# Altium schematic sheet Single_ETU_sht4.SchDoc
size 513 x 386 mm; PageSetup: Record=PageOptions|CenterHorizontal=True|CenterVertical=True|PrintScale=0.69|XCorrection=1.00|YCorrection=1.00|PrintKind=1|BorderSize=5000000|LeftOffset=0|BottomOffset=0|Orientation=2|PaperLength=1000|PaperWidth=1000|Scale=100|PaperSource=15|PrintQuality=1200|MediaType=1|DitherType=10|PrintScaleMode=1|PaperKind=Tabloid|PaperIndex=3
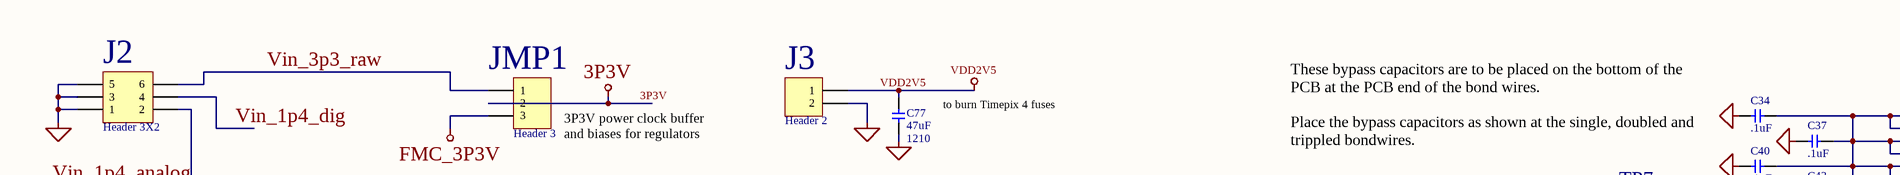
[diagram p0: Single_ETU_sht4.SchDoc, top left]
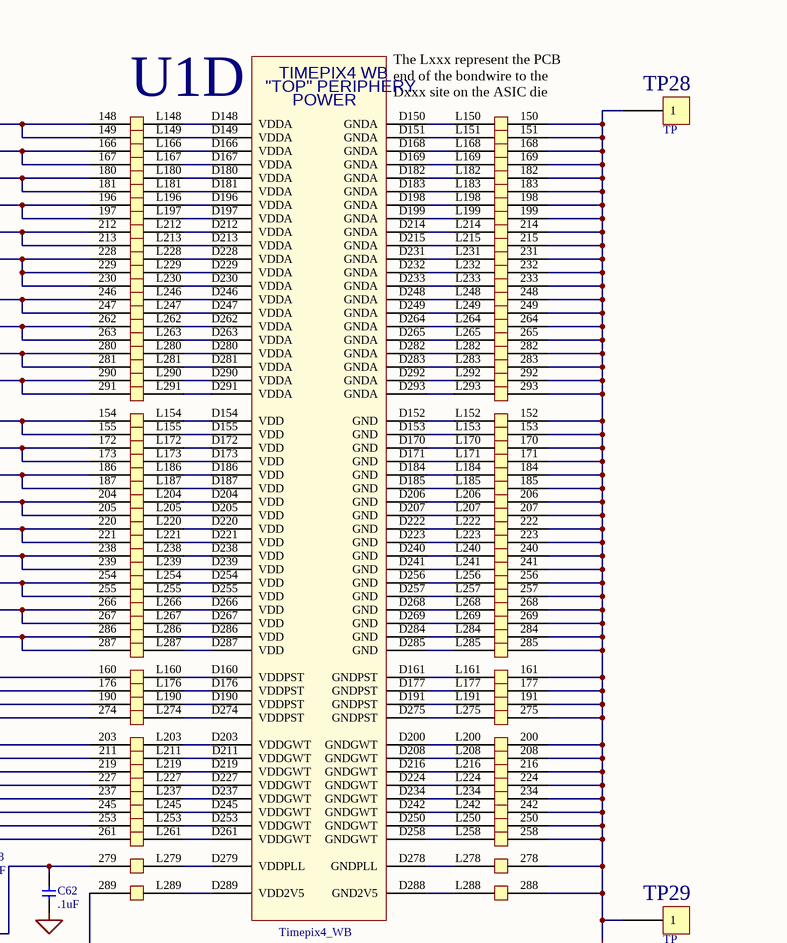
[diagram p1: Single_ETU_sht4.SchDoc, top right]
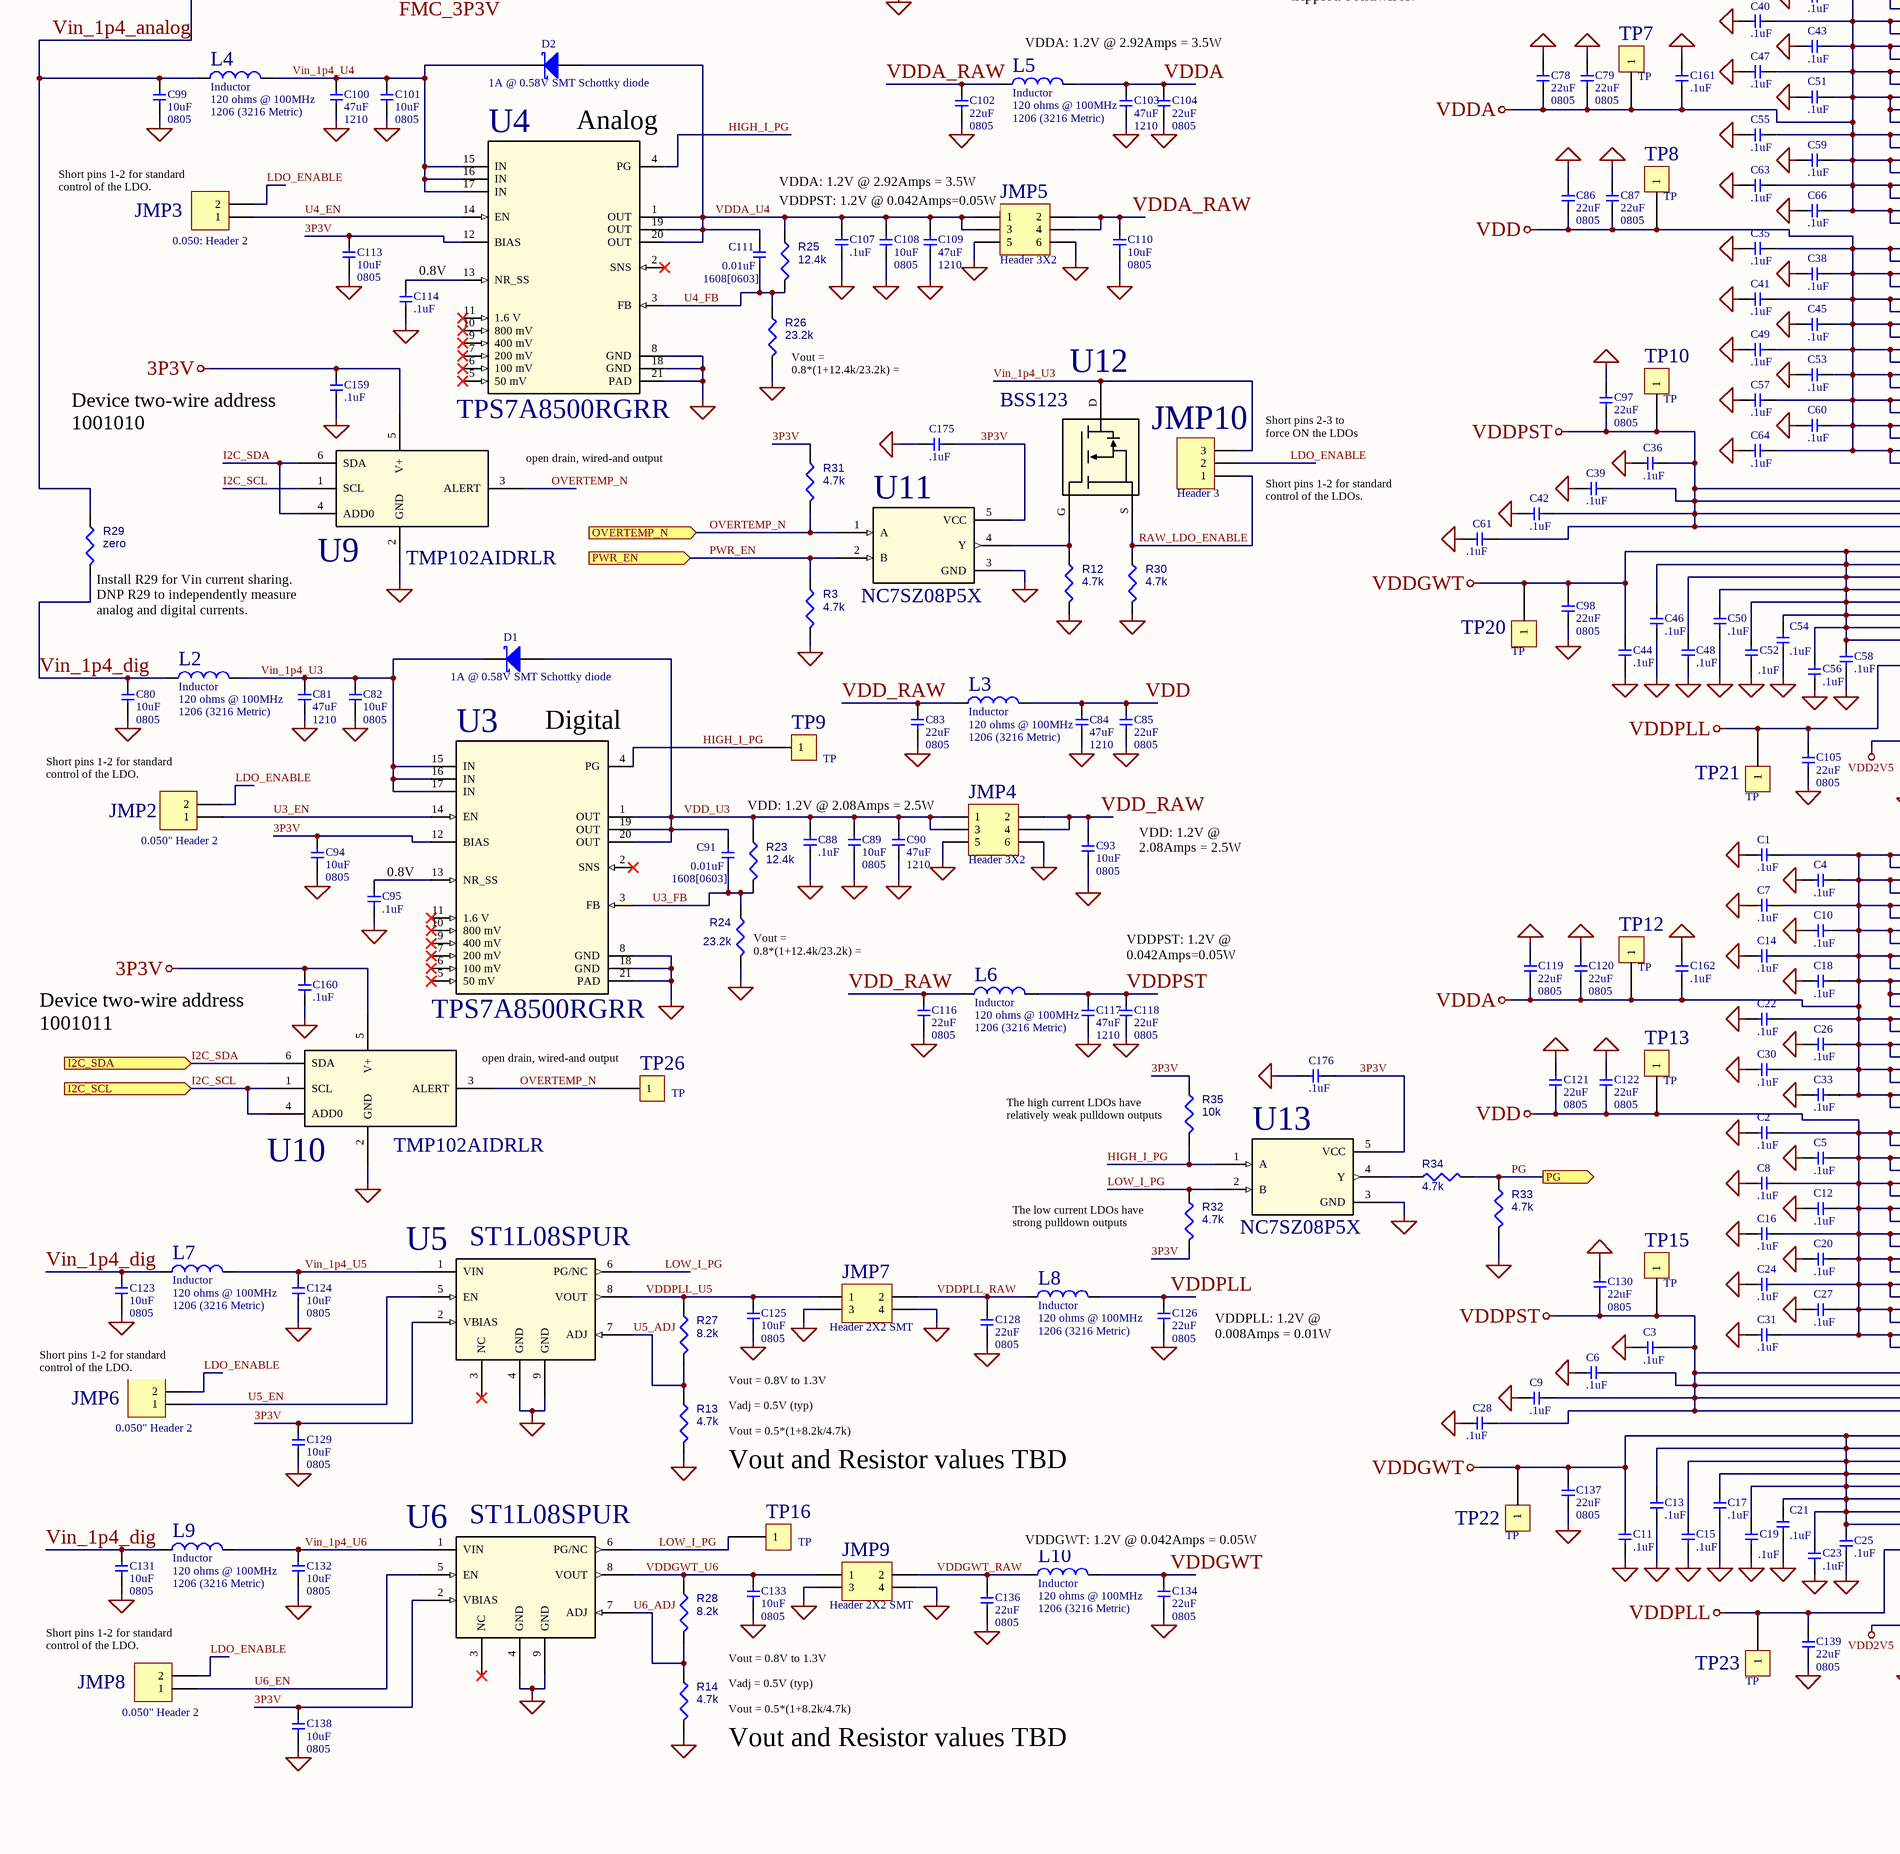
[diagram p2: Single_ETU_sht4.SchDoc, bottom left]
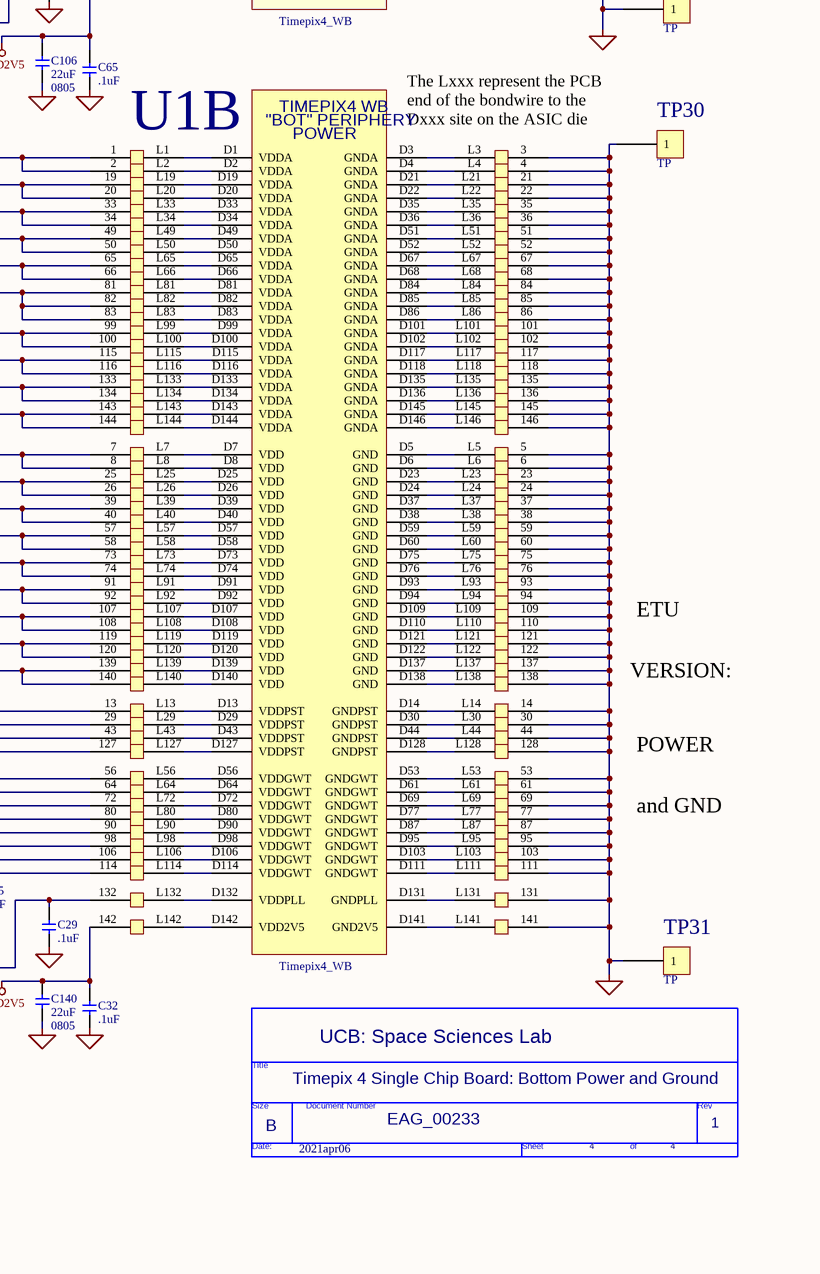
[diagram p3: Single_ETU_sht4.SchDoc, bottom right]

## Parts
*  Page Create Date: 2021apr06  RevCode: 1  Title: Timepix 4 Single Chip Board: Bottom Power and Ground  OrgName: UCB: Space Sciences Lab  Page Size: B  Page Number: 4  Document: EAG_00233  (hidden comment: TitleBlock2)  (graphical)
C1  .1uF  [CAP_0201]
C2  .1uF  [CAP_0201]
C3  .1uF  [CAP_0201]
C4  .1uF  [CAP_0201]
C5  .1uF  [CAP_0201]
C6  .1uF  [CAP_0201]
C7  .1uF  [CAP_0201]
C8  .1uF  [CAP_0201]
C9  .1uF  [CAP_0201]
C10  .1uF  [CAP_0201]
C11  .1uF  [CAP_0201]
C12  .1uF  [CAP_0201]
C13  .1uF  [CAP_0201]
C14  .1uF  [CAP_0201]
C15  .1uF  [CAP_0201]
C16  .1uF  [CAP_0201]
C17  .1uF  [CAP_0201]
C18  .1uF  [CAP_0201]
C19  .1uF  [CAP_0201]
C20  .1uF  [CAP_0201]
C21  .1uF  [CAP_0201]
C22  .1uF  [CAP_0201]
C23  .1uF  [CAP_0201]
C24  .1uF  [CAP_0201]
C25  .1uF  [CAP_0201]
C26  .1uF  [CAP_0201]
C27  .1uF  [CAP_0201]
C28  .1uF  [CAP_0201]
C29  .1uF  [CAP_0201]
C30  .1uF  [CAP_0201]
C31  .1uF  [CAP_0201]
C32  .1uF  [CAP_0201]
C33  .1uF  [CAP_0201]
C34  .1uF  [CAP_0201]
C35  .1uF  [CAP_0201]
C36  .1uF  [CAP_0201]
C37  .1uF  [CAP_0201]
C38  .1uF  [CAP_0201]
C39  .1uF  [CAP_0201]
C40  .1uF  [CAP_0201]
C41  .1uF  [CAP_0201]
C42  .1uF  [CAP_0201]
C43  .1uF  [CAP_0201]
C44  .1uF  [CAP_0201]
C45  .1uF  [CAP_0201]
C46  .1uF  [CAP_0201]
C47  .1uF  [CAP_0201]
C48  .1uF  [CAP_0201]
C49  .1uF  [CAP_0201]
C50  .1uF  [CAP_0201]
C51  .1uF  [CAP_0201]
C52  .1uF  [CAP_0201]
C53  .1uF  [CAP_0201]
C54  .1uF  [CAP_0201]
C55  .1uF  [CAP_0201]
C56  .1uF  [CAP_0201]
C57  .1uF  [CAP_0201]
C58  .1uF  [CAP_0201]
C59  .1uF  [CAP_0201]
C60  .1uF  [CAP_0201]
C61  .1uF  [CAP_0201]
C62  .1uF  [CAP_0201]
C63  .1uF  [CAP_0201]
C64  .1uF  [CAP_0201]
C65  .1uF  [CAP_0201]
C66  .1uF  [CAP_0201]
C77  47uF  Package / Case: 1210  [C1210_M]
C78  22uF  Package / Case: 0805  [C0805]
C79  22uF  Package / Case: 0805  [C0805]
C80  10uF  Package / Case: 0805  [C0805]
C81  47uF  Package / Case: 1210  [C1210_M]
C82  10uF  Package / Case: 0805  [C0805]
C83  22uF  Package / Case: 0805  [C0805]
C84  47uF  Package / Case: 1210  [C1210_M]
C85  22uF  Package / Case: 0805  [C0805]
C86  22uF  Package / Case: 0805  [C0805]
C87  22uF  Package / Case: 0805  [C0805]
C88  .1uF  [CAP_0201]
C89  10uF  Package / Case: 0805  [C0805]
C90  47uF  Package / Case: 1210  [C1210_M]
C91  0.01uF  [1608[0603]]
C93  10uF  Package / Case: 0805  [C0805]
C94  10uF  Package / Case: 0805  [C0805]
C95  .1uF  [CAP_0201]
C97  22uF  Package / Case: 0805  [C0805]
C98  22uF  Package / Case: 0805  [C0805]
C99  10uF  Package / Case: 0805  [C0805]
C100  47uF  Package / Case: 1210  [C1210_M]
C101  10uF  Package / Case: 0805  [C0805]
C102  22uF  Package / Case: 0805  [C0805]
C103  47uF  Package / Case: 1210  [C1210_M]
C104  22uF  Package / Case: 0805  [C0805]
C105  22uF  Package / Case: 0805  [C0805]
C106  22uF  Package / Case: 0805  [C0805]
C107  .1uF  [CAP_0201]
C108  10uF  Package / Case: 0805  [C0805]
C109  47uF  Package / Case: 1210  [C1210_M]
C110  10uF  Package / Case: 0805  [C0805]
C111  0.01uF  [1608[0603]]
C113  10uF  Package / Case: 0805  [C0805]
C114  .1uF  [CAP_0201]
C116  22uF  Package / Case: 0805  [C0805]
C117  47uF  Package / Case: 1210  [C1210_M]
C118  22uF  Package / Case: 0805  [C0805]
C119  22uF  Package / Case: 0805  [C0805]
C120  22uF  Package / Case: 0805  [C0805]
C121  22uF  Package / Case: 0805  [C0805]
C122  22uF  Package / Case: 0805  [C0805]
C123  10uF  Package / Case: 0805  [C0805]
C124  10uF  Package / Case: 0805  [C0805]
C125  10uF  Package / Case: 0805  [C0805]
C126  22uF  Package / Case: 0805  [C0805]
C128  22uF  Package / Case: 0805  [C0805]
C129  10uF  Package / Case: 0805  [C0805]
C130  22uF  Package / Case: 0805  [C0805]
C131  10uF  Package / Case: 0805  [C0805]
C132  10uF  Package / Case: 0805  [C0805]
C133  10uF  Package / Case: 0805  [C0805]
C134  22uF  Package / Case: 0805  [C0805]
C136  22uF  Package / Case: 0805  [C0805]
C137  22uF  Package / Case: 0805  [C0805]
C138  10uF  Package / Case: 0805  [C0805]
C139  22uF  Package / Case: 0805  [C0805]
C140  22uF  Package / Case: 0805  [C0805]
C159  .1uF  [CAP_0201]
C160  .1uF  [CAP_0201]
C161  .1uF  [CAP_0201]
C162  .1uF  [CAP_0201]
C175  .1uF  [CAP_0201]
C176  .1uF  [CAP_0201]
D1  1A @ 0.58V SMT Schottky diode  [DO-219AD]
D2  1A @ 0.58V SMT Schottky diode  [DO-219AD]
J2  Header 3X2  [HDR2X3]
J3  Header 2  [HDR1X2]
JMP1  Header 3  [HDR1X3]
JMP2  0.050" Header 2  [HDR_1x2_SMT_050]
JMP3  0.050: Header 2  [HDR_1x2_SMT_050]
JMP4  Header 3X2  [HDR_2x3]
JMP5  Header 3X2  [HDR_2x3]
JMP6  0.050" Header 2  [HDR_1x2_SMT_050]
JMP7  Header 2X2 SMT  [HDR_2x2_SMT]
JMP8  0.050" Header 2  [HDR_1x2_SMT_050]
JMP9  Header 2X2 SMT  [HDR_2x2_SMT]
JMP10  Header 3  [HDR1X3]
L2  Inductor  value 120 ohms @ 100MHz  Package / Case: 1206 (3216 Metric)  [IND_1206]
L3  Inductor  value 120 ohms @ 100MHz  Package / Case: 1206 (3216 Metric)  [IND_1206]
L4  Inductor  value 120 ohms @ 100MHz  Package / Case: 1206 (3216 Metric)  [IND_1206]
L5  Inductor  value 120 ohms @ 100MHz  Package / Case: 1206 (3216 Metric)  [IND_1206]
L6  Inductor  value 120 ohms @ 100MHz  Package / Case: 1206 (3216 Metric)  [IND_1206]
L7  Inductor  value 120 ohms @ 100MHz  Package / Case: 1206 (3216 Metric)  [IND_1206]
L8  Inductor  value 120 ohms @ 100MHz  Package / Case: 1206 (3216 Metric)  [IND_1206]
L9  Inductor  value 120 ohms @ 100MHz  Package / Case: 1206 (3216 Metric)  [IND_1206]
L10  Inductor  value 120 ohms @ 100MHz  Package / Case: 1206 (3216 Metric)  [IND_1206]
R3  4.7k  [1608[0603]]
R12  4.7k  [1608[0603]]
R13  4.7k  [1608[0603]]
R14  4.7k  [1608[0603]]
R23  12.4k  [1608[0603]]
R24  23.2k  [1608[0603]]
R25  12.4k  [1608[0603]]
R26  23.2k  [1608[0603]]
R27  8.2k  [1608[0603]]
R28  8.2k  [1608[0603]]
R29  zero  [1608[0603]]
R30  4.7k  [1608[0603]]
R31  4.7k  [1608[0603]]
R32  4.7k  [1608[0603]]
R33  4.7k  [1608[0603]]
R34  4.7k  [1608[0603]]
R35  10k  [1608[0603]]
TP7  TP  [TP]
TP8  TP  [TP]
TP9  TP  [TP]
TP10  TP  [TP]
TP12  TP  [TP]
TP13  TP  [TP]
TP15  TP  [TP]
TP16  TP  [TP]
TP20  TP  [TP]
TP21  TP  [TP]
TP22  TP  [TP]
TP23  TP  [TP]
TP26  TP  [TP]
TP28  TP  [TP]
TP29  TP  [TP]
TP30  TP  [TP]
TP31  TP  [TP]
U1  Timepix4_WB  [Timepix4_WB_bands]  (parts B,D of 4)
U3  TPS7A8500RGRR  [RGR0020A]
U4  TPS7A8500RGRR  [RGR0020A]
U5  ST1L08SPUR  [DFN8_2X3_STM]
U6  ST1L08SPUR  [DFN8_2X3_STM]
U9  TMP102AIDRLR  [DRL6]
U10  TMP102AIDRLR  [DRL6]
U11  NC7SZ08P5X  [SC70-5_ONS-L]
U12  BSS123  [SOT23-3_ONS-M]
U13  NC7SZ08P5X  [SC70-5_ONS-L]

## Ports
I2C_SCL (in), I2C_SDA (in), OVERTEMP_N (in), PG (out), PWR_EN (in)

## Nets
3P3V: C94.1 C113.1 C129.1 C138.1 C159.1 C160.1 C175.1 C176.1 JMP1.2 R31.2 R32.1 R35.2 U3.12(BIAS) U4.12(BIAS) U5.2(VBIAS) U6.2(VBIAS) U9.5(V+) U10.5(V+) U11.5(VCC) U13.5(VCC)
FMC_3P3V: JMP1.3
GND: C1.2 C2.2 C3.2 C4.2 C5.2 C6.2 C7.2 C8.2 C9.2 C10.2 C11.2 C12.2 C13.2 C14.2 C15.2 C16.2 C17.2 C18.2 C19.2 C20.2 C21.2 C22.2 C23.2 C24.2 C25.2 C26.2 C27.2 C28.2 C29.2 C30.2 C31.2 C32.2 C33.2 C34.2 C35.2 C36.2 C37.2 C38.2 C39.2 C40.2 C41.2 C42.2 C43.2 C44.2 C45.2 C46.2 C47.2 C48.2 C49.2 C50.2 C51.2 C52.2 C53.2 C54.2 C55.2 C56.2 C57.2 C58.2 C59.2 C60.2 C61.2 C62.2 C63.2 C64.2 C65.2 C66.2 C77.2 C78.2 C79.2 C80.2 C81.2 C82.2 C83.2 C84.2 C85.2 C86.2 C87.2 C88.2 C89.2 C90.2 C93.2 C94.2 C95.2 C97.2 C98.2 C99.2 C100.2 C101.2 C102.2 C103.2 C104.2 C105.2 C106.2 C107.2 C108.2 C109.2 C110.2 C113.2 C114.2 C116.2 C117.2 C118.2 C119.2 C120.2 C121.2 C122.2 C123.2 C124.2 C125.2 C126.2 C128.2 C129.2 C130.2 C131.2 C132.2 C133.2 C134.2 C136.2 C137.2 C138.2 C139.2 C140.2 C159.2 C160.2 C161.2 C162.2 C175.2 C176.2 J2.1 J2.3 J2.5 J3.2 JMP4.5 JMP4.6 JMP5.5 JMP5.6 JMP7.3 JMP7.4 JMP9.3 JMP9.4 R3.1 R12.1 R13.1 R14.1 R24.1 R26.1 R30.1 R33.1 TP28.1 TP29.1 TP30.1 TP31.1 U1.3 U1.4 U1.5 U1.6 U1.14 U1.21 U1.22 U1.23 U1.24 U1.30 U1.35 U1.36 U1.37 U1.38 U1.44 U1.51 U1.52 U1.53 U1.59 U1.60 U1.61 U1.67 U1.68 U1.69 U1.75 U1.76 U1.77 U1.84 U1.85 U1.86 U1.87 U1.93 U1.94 U1.95 U1.101 U1.102 U1.103 U1.109 U1.110 U1.111 U1.117 U1.118 U1.121 U1.122 U1.128 U1.131 U1.135 U1.136 U1.137 U1.138 U1.141 U1.145 U1.146 U1.150 U1.151 U1.152 U1.153 U1.161 U1.168 U1.169 U1.170 U1.171 U1.177 U1.182 U1.183 U1.184 U1.185 U1.191 U1.198 U1.199 U1.200 U1.206 U1.207 U1.208 U1.214 U1.215 U1.216 U1.222 U1.223 U1.224 U1.231 U1.232 U1.233 U1.234 U1.240 U1.241 U1.242 U1.248 U1.249 U1.250 U1.256 U1.257 U1.258 U1.264 U1.265 U1.268 U1.269 U1.275 U1.278 U1.282 U1.283 U1.284 U1.285 U1.288 U1.292 U1.293 U3.8(GND) U3.18(GND) U3.21(PAD) U4.8(GND) U4.18(GND) U4.21(PAD) U5.4(GND) U5.9(GND) U6.4(GND) U6.9(GND) U9.2(GND) U10.2(GND) U11.3(GND) U13.3(GND)
VDD: C2.1 C5.1 C8.1 C12.1 C16.1 C20.1 C24.1 C27.1 C31.1 C35.1 C38.1 C41.1 C45.1 C49.1 C53.1 C57.1 C60.1 C64.1 C84.1 C85.1 C86.1 C87.1 C121.1 C122.1 L3.2 TP8.1 TP13.1 U1.7 U1.8 U1.25 U1.26 U1.39 U1.40 U1.57 U1.58 U1.73 U1.74 U1.91 U1.92 U1.107 U1.108 U1.119 U1.120 U1.139 U1.140 U1.154 U1.155 U1.172 U1.173 U1.186 U1.187 U1.204 U1.205 U1.220 U1.221 U1.238 U1.239 U1.254 U1.255 U1.266 U1.267 U1.286 U1.287
VDD2V5: C32.1 C65.1 C77.1 C106.1 C140.1 J3.1 U1.142 U1.289
VDDA: C1.1 C4.1 C7.1 C10.1 C14.1 C18.1 C22.1 C26.1 C30.1 C33.1 C34.1 C37.1 C40.1 C43.1 C47.1 C51.1 C55.1 C59.1 C63.1 C66.1 C78.1 C79.1 C103.1 C104.1 C119.1 C120.1 C161.1 C162.1 L5.2 TP7.1 TP12.1 U1.1 U1.2 U1.19 U1.20 U1.33 U1.34 U1.49 U1.50 U1.65 U1.66 U1.81 U1.82 U1.83 U1.99 U1.100 U1.115 U1.116 U1.133 U1.134 U1.143 U1.144 U1.148 U1.149 U1.166 U1.167 U1.180 U1.181 U1.196 U1.197 U1.212 U1.213 U1.228 U1.229 U1.230 U1.246 U1.247 U1.262 U1.263 U1.280 U1.281 U1.290 U1.291
VDDGWT: C11.1 C13.1 C15.1 C17.1 C19.1 C21.1 C23.1 C25.1 C44.1 C46.1 C48.1 C50.1 C52.1 C54.1 C56.1 C58.1 C98.1 C134.1 C137.1 L10.2 TP20.1 TP22.1 U1.56 U1.64 U1.72 U1.80 U1.90 U1.98 U1.106 U1.114 U1.203 U1.211 U1.219 U1.227 U1.237 U1.245 U1.253 U1.261
VDDPLL: C29.1 C62.1 C105.1 C126.1 C139.1 L8.2 TP21.1 TP23.1 U1.132 U1.279
VDDPST: C3.1 C6.1 C9.1 C28.1 C36.1 C39.1 C42.1 C61.1 C97.1 C117.1 C118.1 C130.1 L6.2 TP10.1 TP15.1 U1.13 U1.29 U1.43 U1.127 U1.160 U1.176 U1.190 U1.274
HIGH_I_PG: R35.1 TP9.1 U3.4(PG) U4.4(PG) U13.1(A)
I2C_SCL: U9.1(SCL) U10.1(SCL) U10.4(ADD0) ; port I2C_SCL
I2C_SDA: U9.4(ADD0) U9.6(SDA) U10.6(SDA) ; port I2C_SDA
LDO_ENABLE: JMP2.2 JMP3.2 JMP6.2 JMP8.2 JMP10.2
LOW_I_PG: R32.2 TP16.1 U5.6(PG/NC) U6.6(PG/NC) U13.2(B)
OVERTEMP_N: R31.1 TP26.1 U9.3(ALERT) U10.3(ALERT) U11.1(A) ; port OVERTEMP_N
PG: R33.2 R34.1 ; port PG
PWR_EN: R3.2 U11.2(B) ; port PWR_EN
RAW_LDO_ENABLE: JMP10.1 R30.2 U12.S(SOURCE)
U3_EN: JMP2.1 U3.14(EN)
U3_FB: C91.2 R23.1 R24.2 U3.3(FB)
U4_EN: JMP3.1 U4.14(EN)
U4_FB: C111.2 R25.1 R26.2 U4.3(FB)
U5_ADJ: R13.2 R27.1 U5.7(ADJ)
U5_EN: JMP6.1 U5.5(EN)
U6_ADJ: R14.2 R28.1 U6.7(ADJ)
U6_EN: JMP8.1 U6.5(EN)
VDD_RAW: C83.1 C93.1 C116.1 JMP4.2 JMP4.4 L3.1 L6.1
VDD_U3: C88.1 C89.1 C90.1 C91.1 D1.1(A) JMP4.1 JMP4.3 R23.2 U3.1(OUT) U3.19(OUT) U3.20(OUT)
VDDA_RAW: C102.1 C110.1 JMP5.2 JMP5.4 L5.1
VDDA_U4: C107.1 C108.1 C109.1 C111.1 D2.1(A) JMP5.1 JMP5.3 R25.2 U4.1(OUT) U4.19(OUT) U4.20(OUT)
VDDGWT_RAW: C136.1 JMP9.2 L10.1
VDDGWT_U6: C133.1 JMP9.1 R28.2 U6.8(VOUT)
VDDPLL_RAW: C128.1 JMP7.2 L8.1
VDDPLL_U5: C125.1 JMP7.1 R27.2 U5.8(VOUT)
Vin_1p4_analog: C99.1 J2.2 L4.1 R29.2
Vin_1p4_dig: C80.1 C123.1 C131.1 J2.4 L2.1 L7.1 L9.1 R29.1
Vin_1p4_U3: C81.1 C82.1 D1.2(K) JMP10.3 L2.2 U3.15(IN) U3.16(IN) U3.17(IN) U12.D(DRAIN)
Vin_1p4_U4: C100.1 C101.1 D2.2(K) L4.2 U4.15(IN) U4.16(IN) U4.17(IN)
Vin_1p4_U5: C124.1 L7.2 U5.1(VIN)
Vin_1p4_U6: C132.1 L9.2 U6.1(VIN)
Vin_3p3_raw: J2.6 JMP1.1
NetC95_1: C95.1 U3.13(NR_SS)
NetC114_1: C114.1 U4.13(NR_SS)
NetR12_2: R12.2 U11.4(Y) U12.G(GATE)
NetR34_2: R34.2 U13.4(Y)
NetU1_D1: U1.D1(VDDA) U1.L1
NetU1_D2: U1.D2(VDDA) U1.L2
NetU1_D3: U1.D3(GNDA) U1.L3
NetU1_D4: U1.D4(GNDA) U1.L4
NetU1_D5: U1.D5(GND) U1.L5
NetU1_D6: U1.D6(GND) U1.L6
NetU1_D7: U1.D7(VDD) U1.L7
NetU1_D8: U1.D8(VDD) U1.L8
NetU1_D13: U1.D13(VDDPST) U1.L13
NetU1_D14: U1.D14(GNDPST) U1.L14
NetU1_D19: U1.D19(VDDA) U1.L19
NetU1_D20: U1.D20(VDDA) U1.L20
NetU1_D21: U1.D21(GNDA) U1.L21
NetU1_D22: U1.D22(GNDA) U1.L22
NetU1_D23: U1.D23(GND) U1.L23
NetU1_D24: U1.D24(GND) U1.L24
NetU1_D25: U1.D25(VDD) U1.L25
NetU1_D26: U1.D26(VDD) U1.L26
NetU1_D29: U1.D29(VDDPST) U1.L29
NetU1_D30: U1.D30(GNDPST) U1.L30
NetU1_D33: U1.D33(VDDA) U1.L33
NetU1_D34: U1.D34(VDDA) U1.L34
NetU1_D35: U1.D35(GNDA) U1.L35
NetU1_D36: U1.D36(GNDA) U1.L36
NetU1_D37: U1.D37(GND) U1.L37
NetU1_D38: U1.D38(GND) U1.L38
NetU1_D39: U1.D39(VDD) U1.L39
NetU1_D40: U1.D40(VDD) U1.L40
NetU1_D43: U1.D43(VDDPST) U1.L43
NetU1_D44: U1.D44(GNDPST) U1.L44
NetU1_D49: U1.D49(VDDA) U1.L49
NetU1_D50: U1.D50(VDDA) U1.L50
NetU1_D51: U1.D51(GNDA) U1.L51
NetU1_D52: U1.D52(GNDA) U1.L52
NetU1_D53: U1.D53(GNDGWT) U1.L53
NetU1_D56: U1.D56(VDDGWT) U1.L56
NetU1_D57: U1.D57(VDD) U1.L57
NetU1_D58: U1.D58(VDD) U1.L58
NetU1_D59: U1.D59(GND) U1.L59
NetU1_D60: U1.D60(GND) U1.L60
NetU1_D61: U1.D61(GNDGWT) U1.L61
NetU1_D64: U1.D64(VDDGWT) U1.L64
NetU1_D65: U1.D65(VDDA) U1.L65
NetU1_D66: U1.D66(VDDA) U1.L66
NetU1_D67: U1.D67(GNDA) U1.L67
NetU1_D68: U1.D68(GNDA) U1.L68
NetU1_D69: U1.D69(GNDGWT) U1.L69
NetU1_D72: U1.D72(VDDGWT) U1.L72
NetU1_D73: U1.D73(VDD) U1.L73
NetU1_D74: U1.D74(VDD) U1.L74
NetU1_D75: U1.D75(GND) U1.L75
NetU1_D76: U1.D76(GND) U1.L76
NetU1_D77: U1.D77(GNDGWT) U1.L77
NetU1_D80: U1.D80(VDDGWT) U1.L80
NetU1_D81: U1.D81(VDDA) U1.L81
NetU1_D82: U1.D82(VDDA) U1.L82
NetU1_D83: U1.D83(VDDA) U1.L83
NetU1_D84: U1.D84(GNDA) U1.L84
NetU1_D85: U1.D85(GNDA) U1.L85
NetU1_D86: U1.D86(GNDA) U1.L86
NetU1_D87: U1.D87(GNDGWT) U1.L87
NetU1_D90: U1.D90(VDDGWT) U1.L90
NetU1_D91: U1.D91(VDD) U1.L91
NetU1_D92: U1.D92(VDD) U1.L92
NetU1_D93: U1.D93(GND) U1.L93
NetU1_D94: U1.D94(GND) U1.L94
NetU1_D95: U1.D95(GNDGWT) U1.L95
NetU1_D98: U1.D98(VDDGWT) U1.L98
NetU1_D99: U1.D99(VDDA) U1.L99
NetU1_D100: U1.D100(VDDA) U1.L100
NetU1_D101: U1.D101(GNDA) U1.L101
NetU1_D102: U1.D102(GNDA) U1.L102
NetU1_D103: U1.D103(GNDGWT) U1.L103
NetU1_D106: U1.D106(VDDGWT) U1.L106
NetU1_D107: U1.D107(VDD) U1.L107
NetU1_D108: U1.D108(VDD) U1.L108
NetU1_D109: U1.D109(GND) U1.L109
NetU1_D110: U1.D110(GND) U1.L110
NetU1_D111: U1.D111(GNDGWT) U1.L111
NetU1_D114: U1.D114(VDDGWT) U1.L114
NetU1_D115: U1.D115(VDDA) U1.L115
NetU1_D116: U1.D116(VDDA) U1.L116(L8)
NetU1_D117: U1.D117(GNDA) U1.L117
NetU1_D118: U1.D118(GNDA) U1.L118
NetU1_D119: U1.D119(VDD) U1.L119
NetU1_D120: U1.D120(VDD) U1.L120
NetU1_D121: U1.D121(GND) U1.L121
NetU1_D122: U1.D122(GND) U1.L122
NetU1_D127: U1.D127(VDDPST) U1.L127
NetU1_D128: U1.D128(GNDPST) U1.L128
NetU1_D131: U1.D131(GNDPLL) U1.L131
NetU1_D132: U1.D132(VDDPLL) U1.L132
NetU1_D133: U1.D133(VDDA) U1.L133
NetU1_D134: U1.D134(VDDA) U1.L134
NetU1_D135: U1.D135(GNDA) U1.L135
NetU1_D136: U1.D136(GNDA) U1.L136
NetU1_D137: U1.D137(GND) U1.L137
NetU1_D138: U1.D138(GND) U1.L138
NetU1_D139: U1.D139(VDD) U1.L139
NetU1_D140: U1.D140(VDD) U1.L140
NetU1_D141: U1.D141(GND2V5) U1.L141
NetU1_D142: U1.D142(VDD2V5) U1.L142
NetU1_D143: U1.D143(VDDA) U1.L143
NetU1_D144: U1.D144(VDDA) U1.L144
NetU1_D145: U1.D145(GNDA) U1.L145
NetU1_D146: U1.D146(GNDA) U1.L146
NetU1_D148: U1.D148(VDDA) U1.L148
NetU1_D149: U1.D149(VDDA) U1.L149
NetU1_D150: U1.D150(GNDA) U1.L150
NetU1_D151: U1.D151(GNDA) U1.L151
NetU1_D152: U1.D152(GND) U1.L152
NetU1_D153: U1.D153(GND) U1.L153
NetU1_D154: U1.D154(VDD) U1.L154
NetU1_D155: U1.D155(VDD) U1.L155
NetU1_D160: U1.D160(VDDPST) U1.L160
NetU1_D161: U1.D161(GNDPST) U1.L161
NetU1_D166: U1.D166(VDDA) U1.L166
NetU1_D167: U1.D167(VDDA) U1.L167
NetU1_D168: U1.D168(GNDA) U1.L168
NetU1_D169: U1.D169(GNDA) U1.L169
NetU1_D170: U1.D170(GND) U1.L170
NetU1_D171: U1.D171(GND) U1.L171
NetU1_D172: U1.D172(VDD) U1.L172
NetU1_D173: U1.D173(VDD) U1.L173
NetU1_D176: U1.D176(VDDPST) U1.L176
NetU1_D177: U1.D177(GNDPST) U1.L177
NetU1_D180: U1.D180(VDDA) U1.L180
NetU1_D181: U1.D181(VDDA) U1.L181
NetU1_D182: U1.D182(GNDA) U1.L182
NetU1_D183: U1.D183(GNDA) U1.L183
NetU1_D184: U1.D184(GND) U1.L184
NetU1_D185: U1.D185(GND) U1.L185
NetU1_D186: U1.D186(VDD) U1.L186
NetU1_D187: U1.D187(VDD) U1.L187
NetU1_D190: U1.D190(VDDPST) U1.L190
NetU1_D191: U1.D191(GNDPST) U1.L191
NetU1_D196: U1.D196(VDDA) U1.L196
NetU1_D197: U1.D197(VDDA) U1.L197
NetU1_D198: U1.D198(GNDA) U1.L198
NetU1_D199: U1.D199(GNDA) U1.L199
NetU1_D200: U1.D200(GNDGWT) U1.L200
NetU1_D203: U1.D203(VDDGWT) U1.L203
NetU1_D204: U1.D204(VDD) U1.L204
NetU1_D205: U1.D205(VDD) U1.L205
NetU1_D206: U1.D206(GND) U1.L206
NetU1_D207: U1.D207(GND) U1.L207
NetU1_D208: U1.D208(GNDGWT) U1.L208
NetU1_D211: U1.D211(VDDGWT) U1.L211
NetU1_D212: U1.D212(VDDA) U1.L212
NetU1_D213: U1.D213(VDDA) U1.L213
NetU1_D214: U1.D214(GNDA) U1.L214
NetU1_D215: U1.D215(GNDA) U1.L215
NetU1_D216: U1.D216(GNDGWT) U1.L216
NetU1_D219: U1.D219(VDDGWT) U1.L219
NetU1_D220: U1.D220(VDD) U1.L220
NetU1_D221: U1.D221(VDD) U1.L221
NetU1_D222: U1.D222(GND) U1.L222
NetU1_D223: U1.D223(GND) U1.L223
NetU1_D224: U1.D224(GNDGWT) U1.L224
NetU1_D227: U1.D227(VDDGWT) U1.L227
NetU1_D228: U1.D228(VDDA) U1.L228
NetU1_D229: U1.D229(VDDA) U1.L229
NetU1_D230: U1.D230(VDDA) U1.L230
NetU1_D231: U1.D231(GNDA) U1.L231
NetU1_D232: U1.D232(GNDA) U1.L232
NetU1_D233: U1.D233(GNDA) U1.L233
NetU1_D234: U1.D234(GNDGWT) U1.L234
NetU1_D237: U1.D237(VDDGWT) U1.L237
NetU1_D238: U1.D238(VDD) U1.L238
NetU1_D239: U1.D239(VDD) U1.L239
NetU1_D240: U1.D240(GND) U1.L240
NetU1_D241: U1.D241(GND) U1.L241
NetU1_D242: U1.D242(GNDGWT) U1.L242
NetU1_D245: U1.D245(VDDGWT) U1.L245
NetU1_D246: U1.D246(VDDA) U1.L246
NetU1_D247: U1.D247(VDDA) U1.L247
NetU1_D248: U1.D248(GNDA) U1.L248
NetU1_D249: U1.D249(GNDA) U1.L249
NetU1_D250: U1.D250(GNDGWT) U1.L250
NetU1_D253: U1.D253(VDDGWT) U1.L253
NetU1_D254: U1.D254(VDD) U1.L254
NetU1_D255: U1.D255(VDD) U1.L255
NetU1_D256: U1.D256(GND) U1.L256
NetU1_D257: U1.D257(GND) U1.L257
NetU1_D258: U1.D258(GNDGWT) U1.L258
NetU1_D261: U1.D261(VDDGWT) U1.L261
NetU1_D262: U1.D262(VDDA) U1.L262
NetU1_D263: U1.D263(VDDA) U1.L263(L155)
NetU1_D264: U1.D264(GNDA) U1.L264
NetU1_D265: U1.D265(GNDA) U1.L265
NetU1_D266: U1.D266(VDD) U1.L266
NetU1_D267: U1.D267(VDD) U1.L267
NetU1_D268: U1.D268(GND) U1.L268
NetU1_D269: U1.D269(GND) U1.L269
NetU1_D274: U1.D274(VDDPST) U1.L274
NetU1_D275: U1.D275(GNDPST) U1.L275
NetU1_D278: U1.D278(GNDPLL) U1.L278
NetU1_D279: U1.D279(VDDPLL) U1.L279
NetU1_D280: U1.D280(VDDA) U1.L280
NetU1_D281: U1.D281(VDDA) U1.L281
NetU1_D282: U1.D282(GNDA) U1.L282
NetU1_D283: U1.D283(GNDA) U1.L283
NetU1_D284: U1.D284(GND) U1.L284
NetU1_D285: U1.D285(GND) U1.L285
NetU1_D286: U1.D286(VDD) U1.L286
NetU1_D287: U1.D287(VDD) U1.L287
NetU1_D288: U1.D288(GND2V5) U1.L288
NetU1_D289: U1.D289(VDD2V5) U1.L289
NetU1_D290: U1.D290(VDDA) U1.L290
NetU1_D291: U1.D291(VDDA) U1.L291
NetU1_D292: U1.D292(GNDA) U1.L292
NetU1_D293: U1.D293(GNDA) U1.L293

Not connected (* = marked no-connect by the designer): U3 2(SNS)* 5(50_mV)* 6(100_mV)* 7(200_mV)* 9(400_mV)* 10(800_mV)* 11(1.6_V)*; U4 2(SNS)* 5(50_mV)* 6(100_mV)* 7(200_mV)* 9(400_mV)* 10(800_mV)* 11(1.6_V)*; U5 3(NC)*; U6 3(NC)*

## Notes on the sheet
- (near C77) to burn Timepix 4 fuses
- (near U1) The Lxxx represent the PCB
  end of the bondwire to the
  Dxxx site on the ASIC die
- 3P3V power clock buffer
  and biases for regulators
- VDDA: 1.2V @ 2.92Amps = 3.5W
- These bypass capacitors are to be placed on the bottom of the PCB at the PCB end of the bond wires.
  Place the bypass capacitors as shown at the single, doubled and trippled bondwires.
- Analog
- (near JMP3) Short pins 1-2 for standard
  control of the LDO.
- (near JMP5) VDDPST: 1.2V @ 0.042Amps=0.05W
- 0.8V
- Device two-wire address
  1001010
- (near R26) Vout = 0.8*(1+12.4k/23.2k) = 1.2276V
- Short pins 2-3 to
  force ON the LDOs
- (near U9) open drain, wired-and output
- Short pins 1-2 for standard
  control of the LDOs.
- (near R29) Install R29 for Vin current sharing.
  DNP R29 to independently measure analog and digital currents.
- Digital
- (near JMP2) Short pins 1-2 for standard
  control of the LDO.
- VDD: 1.2V @ 2.08Amps = 2.5W
- VDD: 1.2V @
  2.08Amps = 2.5W
- The Lxxx represent the PCB
  end of the bondwire to the
  Dxxx site on the ASIC die
- (near R24) Vout = 0.8*(1+12.4k/23.2k) = 1.2276V
- VDDPST: 1.2V @
  0.042Amps=0.05W
- Device two-wire address
  1001011
- open drain, wired-and output
- (near R35) The high current LDOs have relatively weak pulldown outputs
- (near R32) The low current LDOs have strong pulldown outputs
- ETU
- (near JMP6) Short pins 1-2 for standard
  control of the LDO.
- VDDPLL: 1.2V @
  0.008Amps = 0.01W
- VERSION:
- Vadj = 0.5V (typ)
- Vout = 0.8V to 1.3V
- (near R13) Vout = 0.5*(1+8.2k/4.7k)
- POWER
- Vout and Resistor values TBD
- and GND
- VDDGWT: 1.2V @ 0.042Amps = 0.05W
- (near JMP8) Short pins 1-2 for standard
  control of the LDO.
- (near R14) Vout = 0.5*(1+8.2k/4.7k)
- (near R14) Vout and Resistor values TBD
- (in symbol Timepix4_WB, part B) TIMEPIX4 WB; "BOT" PERIPHERY; POWER
- (in symbol Timepix4_WB, part D) TIMEPIX4 WB; "TOP" PERIPHERY; POWER
- (in symbol TitleBlock2) Title; Size; Document Number; Rev; Date:; Sheet; of

## Library data of the parts
* = TitleBlock2: OrgAddr3: MRD; Page Count: 4
C1-C66 C159-C162 = cap 0.1uF: CAP CER 0.1UF 10V 10% X5R 0201; Voltage - Rated: 6.3V; Supplier 1: Digi-Key; RoHS: RoHS Compliant; Category: Capacitors; Packaging: Cut Tape (CT); Capacitance: .1uF; Tolerance: ±10%; Temperature Coefficient: X5R; Mounting Type: Surface Mount, MLCC; Operating Temperature: -55°C ~ 85°C; Applications: General Purpose; Ratings: -; Package / Case: 0201 (0603 Metric); Size / Dimension: 0.024" L x 0.012" W (0.60mm x 0.30mm); Height - Seated (Max): .013" (0.33mm); Thickness (Max): 0.013" (0.33mm); Lead Spacing: -; Features: -; Lead Style: -
C77 C81 C84 C90 C100 C103 C109 C117 = cap 0.1uF: CAP CER 47UF 10V 10% X7R 1210; Manufacturer: Murata; Supplier 1: Digi-Key; RoHS: RoHS Compliant; Category: Capacitors; Packaging: Cut Tape (CT); Capacitance: 47uF; Voltage - Rated: 10V; Tolerance: ±10%; Temperature Coefficient: X7R; Mounting Type: Surface Mount, MLCC; Operating Temperature: -55°C ~ 125°C; Applications: General Purpose; Ratings: -; Size / Dimension: 0.126" L x 0.098" W (3.20mm x 2.50mm); Height - Seated (Max): .106" (2,7mm); Thickness (Max): 0.106" (2.7mm); Lead Spacing: -; Features: -; Lead Style: -; ComponentLink1URL: Murata; ComponentLink1Description: Murata; ComponentLink2URL: Murata; ComponentLink3URL: Murata
C78 C79 C83 C85-C87 C97 C98 C102 C104-C106 C116 C118-C122 C126 C128 C130 C134 C136 C137 C139 C140 = cap 0.1uF: CAP CER 22UF 10V 10% X5R 0805; Supplier 1: Digi-Key; RoHS: RoHS Compliant; Category: Capacitors; Packaging: Cut Tape (CT); Capacitance: 22uF; Voltage - Rated: 10V; Tolerance: ±10%; Temperature Coefficient: X5R; Mounting Type: Surface Mount, MLCC; Operating Temperature: -55°C ~ 85°C; Applications: General Purpose; Ratings: -; Size / Dimension: 0.079" L x 0.024" W (2.00mm x 1.25mm); Height - Seated (Max): .055" (1.40mm); Thickness (Max): 0.055" (1.4mm); Lead Spacing: -; Features: -; Lead Style: -; ComponentLink1URL: Samsung...; ComponentLink1Description: Samsung...; ComponentLink2URL: Samsung...; ComponentLink3URL: Samsung...
C80 C82 C89 C93 C94 C99 C101 C108 C110 C113 C123-C125 C129 C131-C133 C138 = cap 0.1uF: CAP CER 10UF 10V 10% X7R 0805; Supplier 1: Digi-Key; RoHS: RoHS Compliant; Category: Capacitors; Packaging: Cut Tape (CT); Capacitance: 10uF; Voltage - Rated: 10V; Tolerance: ±10%; Temperature Coefficient: X7R; Mounting Type: Surface Mount, MLCC; Operating Temperature: -55°C ~ 125°C; Applications: General Purpose; Ratings: -; Size / Dimension: 0.079" L x 0.024" W (2.00mm x 1.25mm); Height - Seated (Max): .055" (1.40mm); Thickness (Max): 0.055" (1.4mm); Lead Spacing: -; Features: -; Lead Style: -; ComponentLink1URL: Samsung...; ComponentLink1Description: Samsung...; ComponentLink2URL: Samsung...; ComponentLink3URL: Samsung...
C88 C95 C107 C114 C175 C176 = cap 0.1uF: CAP CER 0.1UF 10V 10% X5R 0201; Manufacturer: TDK Corporation; Voltage - Rated: 6.3V; Supplier 1: Digi-Key; RoHS: RoHS Compliant; Category: Capacitors; Packaging: Cut Tape (CT); Capacitance: .1uF; Tolerance: ±10%; Temperature Coefficient: X5R; Mounting Type: Surface Mount, MLCC; Operating Temperature: -55°C ~ 85°C; Applications: General Purpose; Ratings: -; Package / Case: 0201 (0603 Metric); Size / Dimension: 0.024" L x 0.012" W (0.60mm x 0.30mm); Height - Seated (Max): .013" (0.33mm); Thickness (Max): 0.013" (0.33mm); Lead Spacing: -; Features: -; Lead Style: -; ComponentLink1URL: http://www.tdk.com/pdf/mlcc_prod_guide/MLCC%20Product%20Guide%20A14.pdf; ComponentLink1Description: http://www.tdk.com/pdf/TDKMLCCCapRange.pdf; ComponentLink2URL: http://product.tdk.com/en/catalog/datasheets/mlcc_commercial_general_en.pdf; ComponentLink3URL: http://product.tdk.com/en/catalog/spec/mlccspec_commercial_general_midvoltage_en.pdf
C91 C111 = cap 0.1uF: CAP CER 0.01UF 10V 10% X5R 0603; Supplier 1: Digi-Key; RoHS: RoHS Compliant; Category: Capacitors; Packaging: Cut Tape (CT); Capacitance: 0.01uF; Voltage - Rated: 10V; Tolerance: ±10%; Temperature Coefficient: X5R; Mounting Type: Surface Mount, MLCC; Operating Temperature: -55°C ~ 85°C; Applications: General Purpose; Ratings: -; Package / Case: 1608[0603]; Size / Dimension: 0.063" L x 0.031" W (1.60mm x 0.80mm); Height - Seated (Max): .037" (0.95mm); Thickness (Max): 0.037" (0.95mm); Lead Spacing: -; Features: -; Lead Style: -; ComponentLink1Description: http://www.tdk.com/pdf/TDKMLCCCapRange.pdf; ComponentLink2URL: http://product.tdk.com/en/catalog/datasheets/mlcc_commercial_general_en.pdf; ComponentLink3URL: http://product.tdk.com/en/catalog/spec/mlccspec_commercial_general_midvoltage_en.pdf
D1 D2 = D Schottky: 1A @ 0.58V SMT Schottky diode, TJ -40 to +175degC, Vrrm 100V, Ir 200uA @ 70V @125degC, DO-219AD (MicroSMP); ETU_manf: Vishay; ETU_PN: V1PM10-M3/H; ETU_PN_PO: V1PM10-M3/HGICT-ND; ETU_vendor: Digikey.com; package: DO-219ADC
J2 = Header 3X2: Header, 3-Pin, Dual row; LatestRevisionDate: 17-Jul-2002; LatestRevisionNote: Re-released for DXP Platform.; Publisher: Altium Limited
J3 = Header 2: Header, 2-Pin; LatestRevisionDate: 17-Jul-2002; LatestRevisionNote: Re-released for DXP Platform.; Publisher: Altium Limited
JMP1 JMP10 = Header 3: Header, 3-Pin; LatestRevisionDate: 17-Jul-2002; LatestRevisionNote: Re-released for DXP Platform.; Publisher: Altium Limited
JMP2 JMP3 JMP6 JMP8 = Header 2: Header, 2-Pin, 0.05" pitch; LatestRevisionDate: 17-Jul-2002; LatestRevisionNote: Re-released for DXP Platform.; Publisher: Altium Limited
JMP4 JMP5 = Header 3X2: Header, 3-Pin, Dual row, SMT; LatestRevisionDate: 17-Jul-2002; LatestRevisionNote: Re-released for DXP Platform.; Publisher: Altium Limited
JMP7 JMP9 = Header 2X2: Header, 2-Pin, Dual row, SMT; LatestRevisionDate: 17-Jul-2002; LatestRevisionNote: Re-released for DXP Platform.; Publisher: Altium Limited
L2-L10 = Inductor: Inductor, 120 ohms @ 100MHz, 4amps, 30mOhm, 1206 (3216 metric); Manufacturer: Laird-Signal Integrity Products; Manufacturer Part Number: HI1206P121R-10; DC Resistance (DCR): 0.03 ohms (Max); Applications: power filter; Inductance: 120 ohms @ 100MHz; Current Rating: 4 Amps; ComponentLink1Description: http://www.lairdtech.com/WorkArea/linkit.aspx?LinkIdentifier=id&ItemID=4849; ComponentLink2Description: http://www.lairdtech.com/WorkArea/linkit.aspx?LinkIdentifier=id&ItemID=1939; ComnponentLink3Description: http://lairdtech.thomasnet.com/Asset/Part-Number-Nomenclature-FErrite-EMI.pdf; Packaging: Cut Tape (CT); Height - Seated (Max): 0.051" (1.30mm); Size / Dimension: 0.126" L x 0.062" W (3.20mm x 1.60mm); Mounting Type: Surface Mount; Operating Temperature: *; RoHS: RoHS Compliant; Supplier 1: Digi-Key; Supplier Part Number 1: 240-2410-1-ND; Pricing 1: 1=0.1, 10=0.087, 25=0.0788, 50=0.0708, 100=0.05190, 250=0.03776, 500=0.0346, 1000=0.02989; Thickness (Max): 0.051" (1.30mm); ComponentLink1URL: http://lairdtech.thomasnet.com/item/differential-mode/chip-beads-power-filtering/pn-5776; Category: Inductors
R3 R12-R14 R30-R34 = R: 4.7k ohm 1/10W 50V 1% +/- 25 PPM thin film resistor. 0603.; manf: State of the Art; vendor: State of the Art; package: RM0603
R23 R25 = R: 12.4k ohm 1/10W 50V 1% +/- 25 PPM thin film resistor. 0603.; manf: State of the Art; vendor: State of the Art; package: RM0603
R24 R26 = R: 23.2k ohm 1/10W 50V 1% +/- 25 PPM thin film resistor. 0603.; manf: State of the Art; vendor: State of the Art; package: RM0603
R27 R28 = R: 8.2k ohm 1/10W 50V 1% +/- 25 PPM thin film resistor. 0603.; manf: State of the Art; vendor: State of the Art; package: RM0603
R29 = R: 0 ohm jumper. 1/2W. 20Amp. 0603.; Assembly comment: Do not populate; manf: State of the Art; vendor: State of the Art; package: RM0603
R35 = R: 10k ohm 1/10W 50V 1% +/- 25 PPM thin film resistor. 0603.; manf: State of the Art; vendor: State of the Art; package: RM0603
TP7-TP10 TP12 TP13 TP15 TP16 TP20-TP23 TP26 TP28-TP31 = TP: test point, wire bonding site
U1 = Timepix4_WB: Wire bonding scenario - Top and Bottom peripheries of of the chip - Updated the 27th June 2020
U3 U4 = TPS7A8500RGRR: 4Amp, 1%, 4.4uVrms, LDO regulator; Manufacturer: Texas Instruments; PartNumber: TPS7A8500RGRR; RefDes: RefDes; Type: DEV; Value: Value; Copyright: Copyright (C) 2018 Accelerated Designs. All rights reserved
U5 U6 = ST1L08PUR: No Description Available; Vendor: STMicroelectronics; Built_By: EMA_Cory; SourceLibrary: Add_to_database_2020-12-03; Manufacturer_Part_Number: ST1L08PUR; Copyright: Copyright (C) 2018 Accelerated Designs. All rights reserved; Datasheet: https://www.st.com/content/ccc/resource/technical/document/datasheet/5f/25/d1/3f/f8/25/44/07/DM00123507.pdf/files/DM00123507.pdf/jcr:content/translations/en.DM00123507.pdf; RefDes: RefDes; Type: DEV
U9 U10 = TMP102AIDRLR: Low Power Digital Temperature Sensor with SMBus/Two-Wire Serial Interface in SOT563; GENERIC_PART_NUMBER: TMP102; Vendor: Texas Instruments; PACKAGE_DESIGNATOR: DRL; PIN_COUNT: 6; INDUSTRY_STD_PKG_TYPE: SOT; Manufacturer_Part_Number: TMP102AIDRLR; FAMILY_NAME: TEMPERATURE SENSOR; Datasheet_URL: http://www.ti.com/lit/gpn/TMP102; Manufacturer: Texas Instruments; Copyright: Copyright (C) 2018 Accelerated Designs. All rights reserved; RefDes: RefDes; Type: DEV
U11 U13 = NC7SZ08P5X: Single 2-input AND gate, 1.65-5.5V, 5ns @ 3.3V; Vendor: ON Semiconductor; Built_By: EMA_Jessica; SourceLibrary: ON_Semiconductor_2019-12-30; Manufacturer_Part_Number: NC7SZ08P5X; Copyright: Copyright (C) 2018 Accelerated Designs. All rights reserved; RefDes: RefDes; Type: DEV
U12 = BSS123: SourceLibrary: ON_Semiconductor_2019-12-30; Built_By: EMA_Jessica; Vendor: ON Semiconductor; Copyright: Copyright (C) 2018 Accelerated Designs. All rights reserved; Manufacturer_Part_Number: BSS123; RefDes: RefDes; Type: DEV